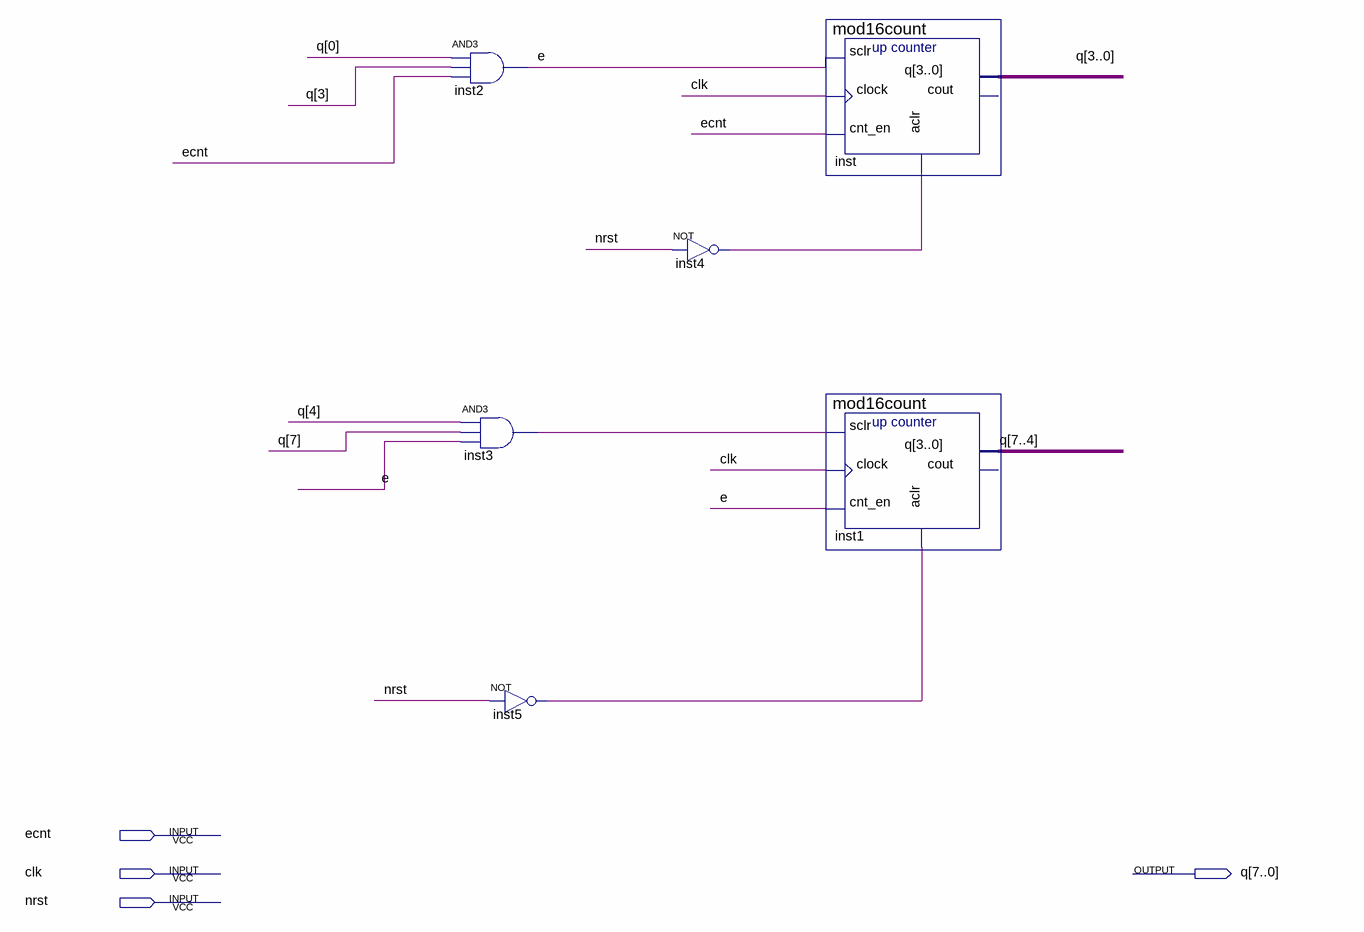
[diagram p0: schematic sheet]
// Quartus schematic BCDcnt.bdf as structural Verilog: 6 symbols, 4 pins
module BCDcnt (
  input  ecnt,
  input  clk,
  input  nrst,
  output [7:0] q
);

  wire e, inst3_out, inst4_out, inst5_out;

  and inst2 (e, q[0], q[3], ecnt);
  and inst3 (inst3_out, q[4], q[7], e);
  not inst5 (inst5_out, nrst);
  not inst4 (inst4_out, nrst);
  mod16count inst (.sclr(e), .clock(clk), .cnt_en(ecnt), .aclr(inst4_out), .q(q[3:0]));  // open: cout
  mod16count inst1 (.sclr(inst3_out), .clock(clk), .cnt_en(e), .aclr(inst5_out), .q(q[7:4]));  // open: cout
endmodule
